# Altium project switch-box.PrjPcb (part 2 of 2)

## Sheet Sensor_Section.SchDoc
size A4; DocumentNumber: 4; SheetNumber: 4; SheetTotal: 8
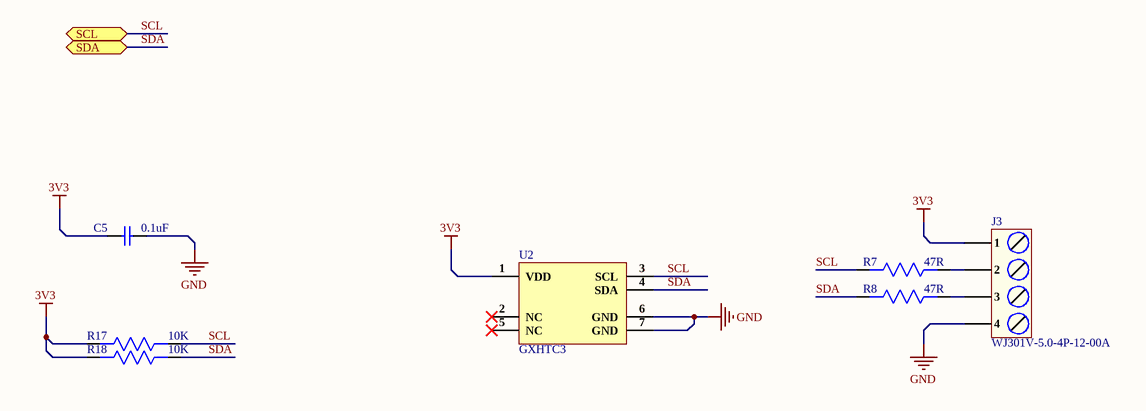
[diagram p3: Sensor_Section.SchDoc]

### Parts
C5  0.1uF  [Cap-0402]
J3  WJ301V-5.0-4P-12-00A  [WJ301V-5.0-4P-12-00A]
R7  47R  [Res-0402]
R8  47R  [Res-0402]
R17  10K  [Res-0603]
R18  10K  [Res-0603]
U2  GXHTC3  [DFN-6-EP(2x2)]

### Ports
SCL (bidir), SDA (bidir)

### Nets
3V3: C5.1 J3.1 R17.2 R18.2 U2.1(VDD)
GND: C5.2 J3.4 U2.6(GND) U2.7(GND)
SCL: R7.2 R17.1 U2.3(SCL) ; port SCL
SDA: R8.2 R18.1 U2.4(SDA) ; port SDA
NetJ3_2: J3.2 R7.1
NetJ3_3: J3.3 R8.1

Not connected (* = marked no-connect by the designer): U2 2(NC)* 5(NC)*

### Library data of the parts
C5 = C1005X5R1H104K050BB: CAP CER 0.1UF 50V X5R 0402; Manufacturer: TDK; Dielectric Material: Ceramic; Capacitance: 100nF; Tolerance: 10%; Supplier 1: Digi-Key; Manufacturer Part Number: C1005X5R1H104K050BB; Stock 1: 1455182; Pricing 1: 1=0.12, 10=0.09, 50=0.049, 100=0.04, 500=0.02858, 1000=0.02245, 2500=0.02041, 5000=0.01878 (USD); Mount: Surface Mount; Case/Package: 0402; Case Code (Metric): 1005; Case Code (Imperial): 0402; Weight: 2.3E-05oz; Min Operating Temperature: -55°C; Max Operating Temperature: 85°C; Dielectric: X5R; Voltage Rating: 50V; Packaging: Tape and Reel; Voltage Rating (DC): 50V; Termination: SMD/SMT; Construction: Flat; Package Quantity: 1; Resistor Type: Ceramic; Voltage: 50V; Series: C; Length: 1mm; Width: 0.02inch; Height: 0.5mm; Depth: 0.5mm; Thickness: 0.022inch; Radiation Hardening: No; Lead Free: Lead Free; REACH SVHC: No SVHC; RoHS Compliant: Yes; ComponentLink1URL: https://product.tdk.com/info/en/catalog/spec/mlccspec_commercial_general_midvoltage_en.pdf?src-supplier=Digi-Key; ComponentLink1Description: https://product.tdk.com/info/en/catalog/spec/mlccspec_commercial_general_midvoltage_en.pdf?src-supplier=Digi-Key; ComponentLink2URL: http://www.tdk.co.jp/tefe02/e413_c.pdf?src-supplier=Future+Electronics; ComponentLink2Description: http://www.tdk.co.jp/tefe02/e413_c.pdf?src-supplier=Future+Electronics; ComponentLink3URL: https://www.verical.com/server-webapp/html/getDatasheet?partID=743571&src-supplier=Verical; ComponentLink3Description: https://www.verical.com/server-webapp/html/getDatasheet?partID=743571&src-supplier=Verical; ComponentLink4URL: http://www.tdk.co.jp/tefe02/e412_c.pdf?src-supplier=Avnet+Europe; ComponentLink4Description: http://www.tdk.co.jp/tefe02/e412_c.pdf?src-supplier=Avnet+Europe; Supplier Part Number 1: 445-5942-1-ND; LCSC Part Number: C2181865
J3 = WJ301V-5.0-4P-12-00A: Plugin,P=5mm Screw terminal ROHS; Manufacturer: Ningbo Kangnex Elec; Item Type: Terminal Block; Manufacturer Part Number: WJ301V-5.0-4P-12-00A; Package: Plugin,P=5mm; LCSC Part Number: C3031442; ComponentLink1Description: LCSC; ComponentLink1URL: https://www.lcsc.com/product-detail/Screw-terminal_Ningbo-Kangnex-Elec-WJ301V-5-0-4P-12-00A_C3031442.html
R7 R8 = ERJ-2RKF47R0X: RES SMD 47 OHM 1% 1/10W 0402; Manufacturer: Panasonic; Temperature Coefficient: 100ppm/°C; Power Rating: 100mW; Voltage Rating: 50V; Item Type: Resistor; Supplier 1: Avnet; Manufacturer Part Number: ERJ-2RKF47R0X; RoHS: Yes; Category: Chip SMD Resistors; Stock 1: 48669; Pricing 1: 1=0.08100, 25=0.03700, 100=0.01500, 250=0.01300, 500=0.01000, 1000=0.00700, 2500=0.00500 (USD); Mount: Surface Mount; Case/Package: 0402; Number of Pins: 2; Contact Plating: Tin; Case Code (Metric): 1005; Case Code (Imperial): 0402; Weight: 2.8E-05oz; Min Operating Temperature: -55°C; Max Operating Temperature: 155°C; Resistance: 47R; Tolerance: 1%; Resistor Type: Thick Film; Packaging: Tape and Reel; Package Quantity: 1; Number of Terminations: 2; Termination: SMD/SMT; Max Power Dissipation: 100mW; Voltage Rating (DC): 50V; Features: Automotive AEC-Q200; Series: ERJ; Resistance Tolerance: 1%; Construction: Rectangular; Technology: THICK FILM; Length: 1mm; Width: 0.5mm; Height: 0.35mm; Depth: 0.5mm; Reach SVHC Compliant: Yes; Military Standard: Not; Lead Free: Lead Free; RoHS Compliant: Yes; ComponentLink1URL: https://datasheet.ciiva.com/11821/0900766b80f80784-11821333.pdf?src-supplier=RSComponents; ComponentLink1Description: https://datasheet.ciiva.com/11821/0900766b80f80784-11821333.pdf?src-supplier=RSComponents; ComponentLink2URL: https://datasheet.ciiva.com/6082/aoa0000ce2-6082054.pdf?src-supplier=Farnell; ComponentLink2Description: https://datasheet.ciiva.com/6082/aoa0000ce2-6082054.pdf?src-supplier=Farnell; ComponentLink3URL: https://datasheet.ciiva.com/7886/aoa0000ce2-7886719.pdf?src-supplier=Element14; ComponentLink3Description: https://datasheet.ciiva.com/7886/aoa0000ce2-7886719.pdf?src-supplier=Element14; ComponentLink4URL: https://datasheet.ciiva.com/7887/426256-7887019.pdf?src-supplier=Element14; ComponentLink4Description: https://datasheet.ciiva.com/7887/426256-7887019.pdf?src-supplier=Element14; ComponentLink5URL: https://datasheet.ciiva.com/43467/1678782-43467189.pdf?src-supplier=Farnell; ComponentLink5Description: https://datasheet.ciiva.com/43467/1678782-43467189.pdf?src-supplier=Farnell; ComponentLink6URL: https://datasheet.ciiva.com/46373/1678782-46373909.pdf?src-supplier=Element14; ComponentLink6Description: https://datasheet.ciiva.com/46373/1678782-46373909.pdf?src-supplier=Element14; ComponentLink7URL: https://datasheet.ciiva.com/22684/1678782-22684775.pdf?src-supplier=Element14; ComponentLink7Description: https://datasheet.ciiva.com/22684/1678782-22684775.pdf?src-supplier=Element14; ComponentLink8URL: https://datasheet.ciiva.com/46373/1678782-46373910.pdf?src-supplier=Element14; ComponentLink8Description: https://datasheet.ciiva.com/46373/1678782-46373910.pdf?src-supplier=Element14; ComponentLink9URL: https://datasheet.ciiva.com/24165/aoa0000ce2-24165246.pdf?src-supplier=Mouser; ComponentLink9Description: https://datasheet.ciiva.com/24165/aoa0000ce2-24165246.pdf?src-supplier=Mouser; ComponentLink10URL: https://datasheet.ciiva.com/16786/70260748-16786359.pdf?src-supplier=Allied+Electronics; ComponentLink10Description: https://datasheet.ciiva.com/16786/70260748-16786359.pdf?src-supplier=Allied+Electronics; ComponentLink11URL: https://datasheet.ciiva.com/16783/70260748-16783259.pdf?src-supplier=Allied+Electronics; ComponentLink11Description: https://datasheet.ciiva.com/16783/70260748-16783259.pdf?src-supplier=Allied+Electronics; ComponentLink12URL: https://datasheet.ciiva.com/9189/aoa0000ce2-9189325.pdf?src-supplier=Avnet; ComponentLink12Description: https://datasheet.ciiva.com/9189/aoa0000ce2-9189325.pdf?src-supplier=Avnet; ComponentLink13URL: https://datasheet.ciiva.com/9189/aoa0000ce2-9189323.pdf?src-supplier=Avnet; ComponentLink13Description: https://datasheet.ciiva.com/9189/aoa0000ce2-9189323.pdf?src-supplier=Avnet; Supplier Part Number 1: 64R5286; LCSC Part Number: C413056
R17 R18 = RC0603FR-0710KL: RES SMD 10K Ohm 1% 1/10W 0603; Manufacturer: Yageo; Resistance: 10kR; Temperature Coefficient: 100ppm/°C; Voltage Rating (DC): 50V; Power Rating: 100mW; Voltage Rating: 75V; Supplier 1: Digi-Key; Manufacturer Part Number: RC0603FR-0710KL; RoHS: Yes; Category: Chip SMD Resistors; Stock 1: 25249139; Pricing 1: 1=0.10000, 10=0.02400, 100=0.00970, 1000=0.00436, 2500=0.00378 (USD); Case/Package: 0603; Number of Pins: 2; Case Code (Imperial): 0603; Case Code (Metric): 1608; Weight: 7.1E-05oz; Size Code: 0603; Min Operating Temperature: -55°C; Max Operating Temperature: 155°C; Tolerance: 1%; Resistor Type: Thick Film; Packaging: Tape and Reel; Termination: SMD/SMT; Features: Moisture Resistant; Series: RC; Max Power Dissipation: 100mW; Number of Terminations: 2; Resistance Tolerance: 1%; Construction: Rectangular; Length: 1.6mm; Width: 0.8mm; Height: 0.45mm; Depth: 0.8mm; Lead Pitch: 0.3mm; REACH SVHC: Unknown; Lead Free: Lead Free; Military Standard: Not; RoHS Compliant: Yes; ComponentLink1URL: https://datasheet.ciiva.com/7660/38590-7660789.pdf?src-supplier=Element14; ComponentLink1Description: https://datasheet.ciiva.com/7660/38590-7660789.pdf?src-supplier=Element14; ComponentLink2URL: https://datasheet.ciiva.com/7983/443971-7983596.pdf?src-supplier=Element14; ComponentLink2Description: https://datasheet.ciiva.com/7983/443971-7983596.pdf?src-supplier=Element14; ComponentLink3URL: https://datasheet.ciiva.com/22747/443971-22747519.pdf?src-supplier=Element14; ComponentLink3Description: https://datasheet.ciiva.com/22747/443971-22747519.pdf?src-supplier=Element14; ComponentLink4URL: https://datasheet.ciiva.com/46440/1868787-46440891.pdf?src-supplier=Element14; ComponentLink4Description: https://datasheet.ciiva.com/46440/1868787-46440891.pdf?src-supplier=Element14; ComponentLink5URL: https://datasheet.ciiva.com/7746/1738695-7746239.pdf?src-supplier=Element14; ComponentLink5Description: https://datasheet.ciiva.com/7746/1738695-7746239.pdf?src-supplier=Element14; ComponentLink6URL: https://datasheet.ciiva.com/15189/getdatasheetpartid-409289-15189591.pdf?src-supplier=Verical; ComponentLink6Description: https://datasheet.ciiva.com/15189/getdatasheetpartid-409289-15189591.pdf?src-supplier=Verical; Supplier Part Number 1: 311-10.0KHRCT-ND; LCSC Part Number: C98220
U2 = GXHTC3: DFN-6-EP(2x2) Temperature and Humidity Sensor ROHS; Manufacturer: GXCAS; Item Type: Temperature & Humidity Sensor; Manufacturer Part Number: GXHTC3; Package: DFN-6-EP(2x2); LCSC Part Number: C2837688; ComponentLink1Description: LCSC; ComponentLink1URL: https://www.lcsc.com/product-detail/Temperature-and-Humidity-Sensor_GXCAS-GXHTC3_C2837688.html

## Sheet Isolator_Section.SchDoc
size A; DocumentNumber: 5; SheetNumber: 5; SheetTotal: 8
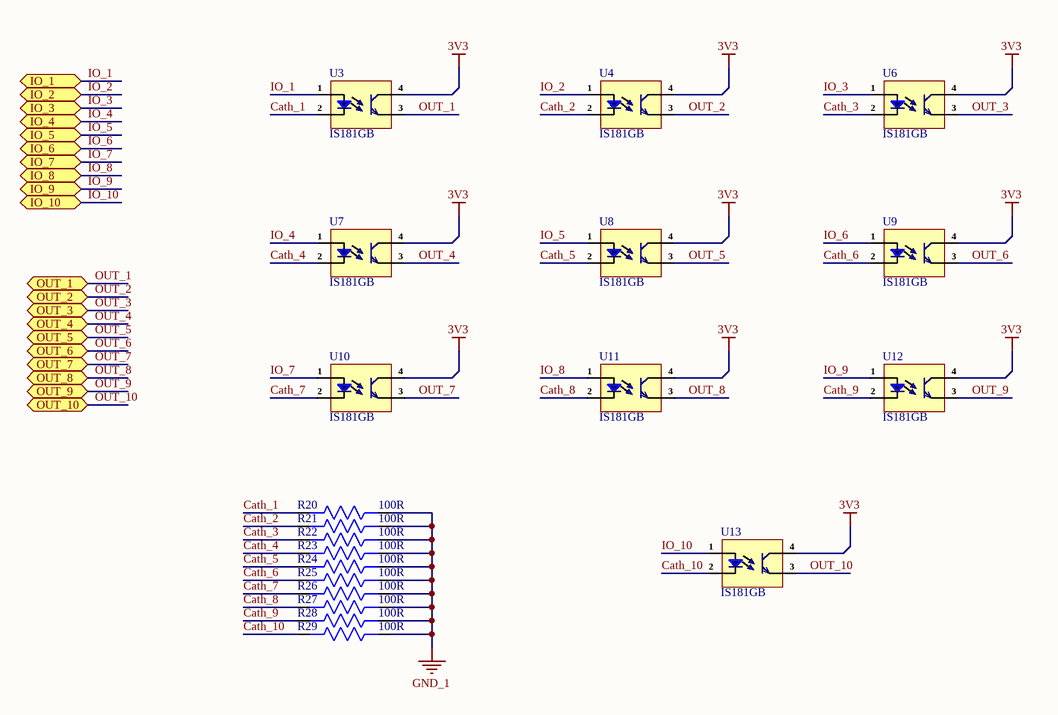
[diagram p4: Isolator_Section.SchDoc]

### Parts
R20  100R  [Res-0402]
R21  100R  [Res-0402]
R22  100R  [Res-0402]
R23  100R  [Res-0402]
R24  100R  [Res-0402]
R25  100R  [Res-0402]
R26  100R  [Res-0402]
R27  100R  [Res-0402]
R28  100R  [Res-0402]
R29  100R  [Res-0402]
U3  IS181GB  [SOP-4_2.54]
U4  IS181GB  [SOP-4_2.54]
U6  IS181GB  [SOP-4_2.54]
U7  IS181GB  [SOP-4_2.54]
U8  IS181GB  [SOP-4_2.54]
U9  IS181GB  [SOP-4_2.54]
U10  IS181GB  [SOP-4_2.54]
U11  IS181GB  [SOP-4_2.54]
U12  IS181GB  [SOP-4_2.54]
U13  IS181GB  [SOP-4_2.54]

### Ports
IO_1 (bidir), IO_2 (bidir), IO_3 (bidir), IO_4 (bidir), IO_5 (bidir), IO_6 (bidir), IO_7 (bidir), IO_8 (bidir), IO_9 (bidir), IO_10 (bidir), OUT_1 (bidir), OUT_2 (bidir), OUT_3 (bidir), OUT_4 (bidir), OUT_5 (bidir), OUT_6 (bidir), OUT_7 (bidir), OUT_8 (bidir), OUT_9 (bidir), OUT_10 (bidir)

### Nets
3V3: U3.4(C) U4.4(C) U6.4(C) U7.4(C) U8.4(C) U9.4(C) U10.4(C) U11.4(C) U12.4(C) U13.4(C)
GND_1: R20.1 R21.1 R22.1 R23.1 R24.1 R25.1 R26.1 R27.1 R28.1 R29.1
Cath_1: R20.2 U3.2(Ca)
Cath_2: R21.2 U4.2(Ca)
Cath_3: R22.2 U6.2(Ca)
Cath_4: R23.2 U7.2(Ca)
Cath_5: R24.2 U8.2(Ca)
Cath_6: R25.2 U9.2(Ca)
Cath_7: R26.2 U10.2(Ca)
Cath_8: R27.2 U11.2(Ca)
Cath_9: R28.2 U12.2(Ca)
Cath_10: R29.2 U13.2(Ca)
IO_1: U3.1(An) ; port IO_1
IO_2: U4.1(An) ; port IO_2
IO_3: U6.1(An) ; port IO_3
IO_4: U7.1(An) ; port IO_4
IO_5: U8.1(An) ; port IO_5
IO_6: U9.1(An) ; port IO_6
IO_7: U10.1(An) ; port IO_7
IO_8: U11.1(An) ; port IO_8
IO_9: U12.1(An) ; port IO_9
IO_10: U13.1(An) ; port IO_10
OUT_1: U3.3(E) ; port OUT_1
OUT_2: U4.3(E) ; port OUT_2
OUT_3: U6.3(E) ; port OUT_3
OUT_4: U7.3(E) ; port OUT_4
OUT_5: U8.3(E) ; port OUT_5
OUT_6: U9.3(E) ; port OUT_6
OUT_7: U10.3(E) ; port OUT_7
OUT_8: U11.3(E) ; port OUT_8
OUT_9: U12.3(E) ; port OUT_9
OUT_10: U13.3(E) ; port OUT_10

### Library data of the parts
R20-R29 = RC0402FR-07100RL: RES 100 OHM 1% 1/16W 0402; Manufacturer: Yageo; Power Rating: 62.5mW; Voltage Rating: 50V; Temperature Coefficient: 100ppm/°C; Max Power Dissipation: 63mW; Supplier 1: Mouser; Manufacturer Part Number: RC0402FR-07100RL; RoHS: Yes; Category: Chip SMD Resistors; Stock 1: 699545; Pricing 1: 1=0.10000, 10=0.01200, 50=0.01200, 100=0.00500, 1000=0.00300, 2500=0.00200, 10000=0.00100 (USD); Case/Package: 0402; Number of Pins: 2; Case Code (Imperial): 0402; Case Code (Metric): 1005; Size Code: 0402; Min Operating Temperature: -55°C; Max Operating Temperature: 155°C; Tolerance: 1%; Voltage Rating (DC): 50V; Resistance: 100R; Packaging: Tape and Reel; Termination: SMD/SMT; Resistor Type: Thick Film; Features: Moisture Resistant; Series: RC; Number of Terminations: 2; Resistance Tolerance: 1%; Construction: Rectangular; Technology: THICK FILM; Length: 1mm; Width: 0.5mm; Height: 0.32mm; Depth: 0.5mm; RoHS Compliant: Yes; REACH SVHC: No SVHC; Military Standard: Not; Lead Free: Lead Free; ComponentLink1URL: https://datasheet.ciiva.com/11808/0900766b80c66297-11808765.pdf?src-supplier=RSComponents; ComponentLink1Description: https://datasheet.ciiva.com/11808/0900766b80c66297-11808765.pdf?src-supplier=RSComponents; ComponentLink2URL: https://datasheet.ciiva.com/7849/1784430-7849810.pdf?src-supplier=Element14; ComponentLink2Description: https://datasheet.ciiva.com/7849/1784430-7849810.pdf?src-supplier=Element14; ComponentLink3URL: https://datasheet.ciiva.com/28367/1018594-28367226.pdf?src-supplier=Element14; ComponentLink3Description: https://datasheet.ciiva.com/28367/1018594-28367226.pdf?src-supplier=Element14; ComponentLink4URL: https://datasheet.ciiva.com/22747/1018594-22747511.pdf?src-supplier=Element14; ComponentLink4Description: https://datasheet.ciiva.com/22747/1018594-22747511.pdf?src-supplier=Element14; ComponentLink5URL: https://datasheet.ciiva.com/12667/pyu-rc0402-51-rohs-l-6-r-12667957.pdf?src-supplier=Mouser; ComponentLink5Description: https://datasheet.ciiva.com/12667/pyu-rc0402-51-rohs-l-6-r-12667957.pdf?src-supplier=Mouser; ComponentLink6URL: https://datasheet.ciiva.com/15189/getdatasheetpartid-329466-15189335.pdf?src-supplier=Verical; ComponentLink6Description: https://datasheet.ciiva.com/15189/getdatasheetpartid-329466-15189335.pdf?src-supplier=Verical; ComponentLink7URL: https://datasheet.ciiva.com/16740/pyu-rc0402-51-rohs-l-6-r-16740566.pdf?src-supplier=Future+Electronics; ComponentLink7Description: https://datasheet.ciiva.com/16740/pyu-rc0402-51-rohs-l-6-r-16740566.pdf?src-supplier=Future+Electronics; Supplier Part Number 1: 603-RC0402FR-07100RL; LCSC Part Number: C106232
U3 U4 U6-U13 = IS181GB: Optoisolator Transistor Output 3750Vrms 1 Channel; Manufacturer: Isocom; Forward Current: 50mA; Reverse Breakdown Voltage: 6V; Isolation Voltage: 3.75kV; Rise Time: 18000ns; Power Dissipation: 170mW; Number of Elements: 1; Collector Emitter Saturation Voltage: 200mV; Forward Voltage: 1.4V; Collector Emitter Voltage (VCEO): 80V; Current Transfer Ratio: 600%; Item Type: Optocoupler; Supplier 1: Arrow Electronics; Manufacturer Part Number: IS181GB; RoHS: Yes; Category: Optocouplers; Stock 1: 2922; Pricing 1: 1=0.55080, 10=0.34190, 25=0.33860, 50=0.33530, 100=0.19360, 250=0.19160, 500=0.18960, 1000=0.14750 (USD); Mount: Surface Mount; Case/Package: SMD/SMT; Number of Pins: 4; Min Operating Temperature: -55°C; Max Operating Temperature: 100°C; Fall Time: 18000ns; Radiation Hardening: No; Lead Free: Lead Free; RoHS Compliant: Yes; ComponentLink1URL: https://datasheet.ciiva.com/26895/getdatasheetpartid-624485-26895717.pdf?src-supplier=Verical; ComponentLink1Description: https://datasheet.ciiva.com/26895/getdatasheetpartid-624485-26895717.pdf?src-supplier=Verical; ComponentLink2URL: https://datasheet.ciiva.com/29301/183289-da-01-en-optokoppler-is181-gb-29301106.pdf?src-supplier=Conrad; ComponentLink2Description: https://datasheet.ciiva.com/29301/183289-da-01-en-optokoppler-is181-gb-29301106.pdf?src-supplier=Conrad; Supplier Part Number 1: IS181GB; LCSC Part Number: C84196

## Sheet Relay_Section.SchDoc: =Projectname
size A4; DocumentNumber: 7; SheetNumber: 7; SheetTotal: 8
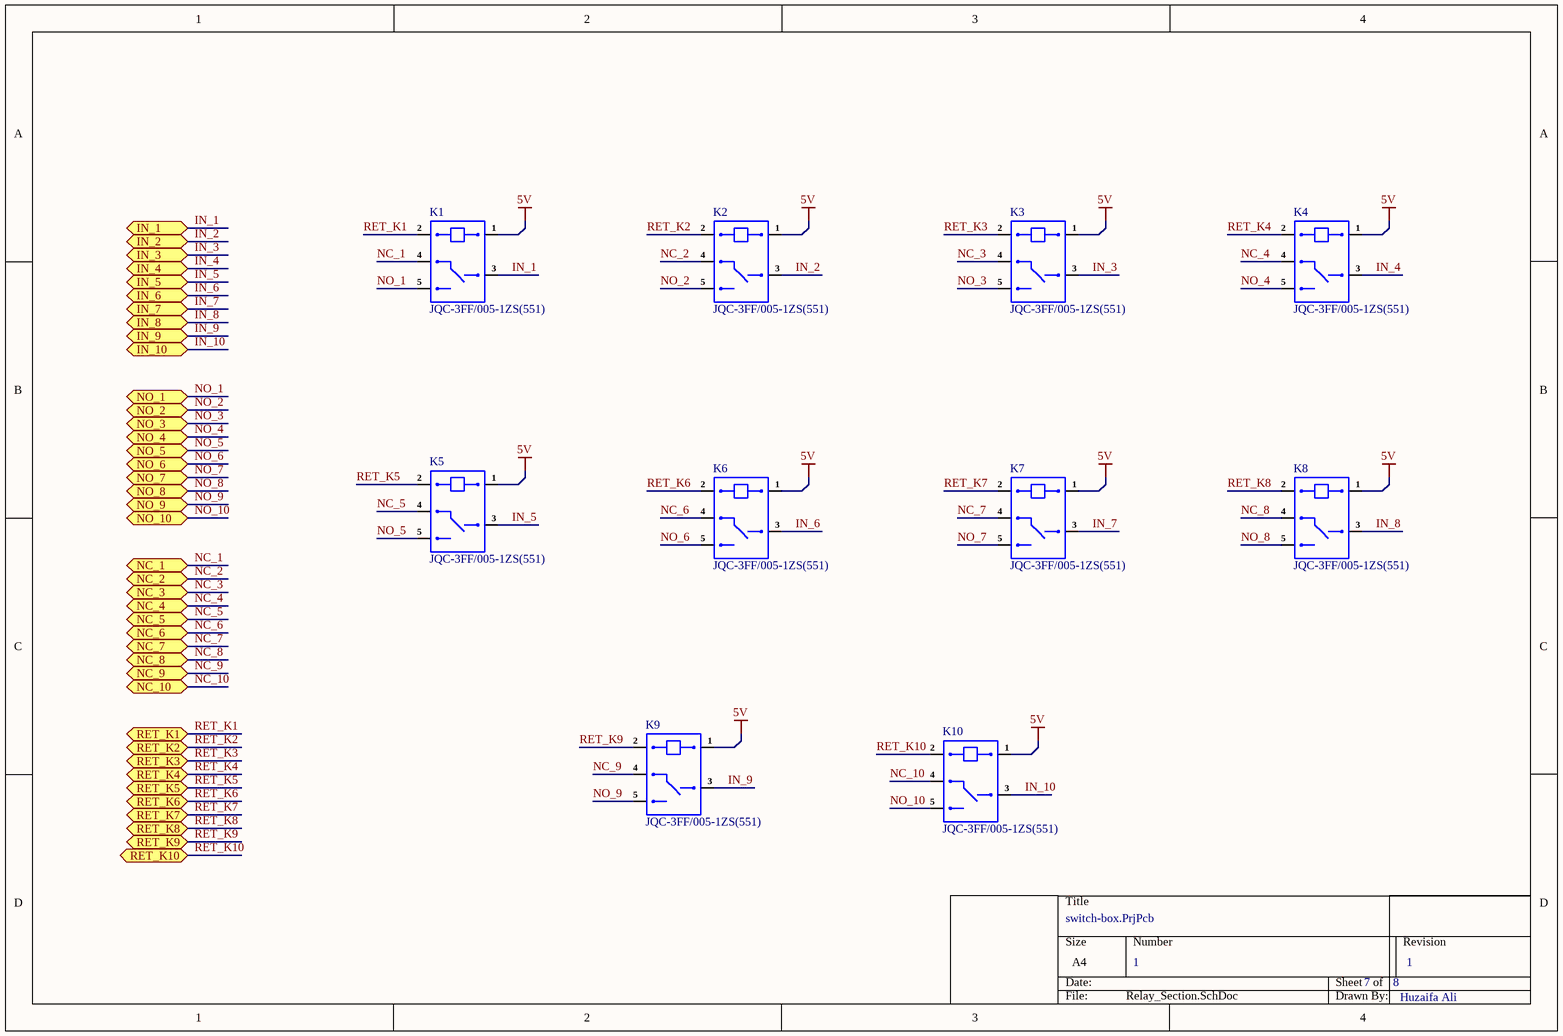
[diagram p5: Relay_Section.SchDoc]

### Parts
K1  JQC-3FF/005-1ZS(551)  [JQC-3FF/005-1ZS(551)]
K2  JQC-3FF/005-1ZS(551)  [JQC-3FF/005-1ZS(551)]
K3  JQC-3FF/005-1ZS(551)  [JQC-3FF/005-1ZS(551)]
K4  JQC-3FF/005-1ZS(551)  [JQC-3FF/005-1ZS(551)]
K5  JQC-3FF/005-1ZS(551)  [JQC-3FF/005-1ZS(551)]
K6  JQC-3FF/005-1ZS(551)  [JQC-3FF/005-1ZS(551)]
K7  JQC-3FF/005-1ZS(551)  [JQC-3FF/005-1ZS(551)]
K8  JQC-3FF/005-1ZS(551)  [JQC-3FF/005-1ZS(551)]
K9  JQC-3FF/005-1ZS(551)  [JQC-3FF/005-1ZS(551)]
K10  JQC-3FF/005-1ZS(551)  [JQC-3FF/005-1ZS(551)]

### Ports
IN_1 (bidir), IN_2 (bidir), IN_3 (bidir), IN_4 (bidir), IN_5 (bidir), IN_6 (bidir), IN_7 (bidir), IN_8 (bidir), IN_9 (bidir), IN_10 (bidir), NC_1 (bidir), NC_2 (bidir), NC_3 (bidir), NC_4 (bidir), NC_5 (bidir), NC_6 (bidir), NC_7 (bidir), NC_8 (bidir), NC_9 (bidir), NC_10 (bidir), NO_1 (bidir), NO_2 (bidir), NO_3 (bidir), NO_4 (bidir), NO_5 (bidir), NO_6 (bidir), NO_7 (bidir), NO_8 (bidir), NO_9 (bidir), NO_10 (bidir), RET_K1 (bidir), RET_K2 (bidir), RET_K3 (bidir), RET_K4 (bidir), RET_K5 (bidir), RET_K6 (bidir), RET_K7 (bidir), RET_K8 (bidir), RET_K9 (bidir), RET_K10 (bidir)

### Nets
5V: K1.1 K2.1 K3.1 K4.1 K5.1 K6.1 K7.1 K8.1 K9.1 K10.1
IN_1: K1.3 ; port IN_1
IN_2: K2.3 ; port IN_2
IN_3: K3.3 ; port IN_3
IN_4: K4.3 ; port IN_4
IN_5: K5.3 ; port IN_5
IN_6: K6.3 ; port IN_6
IN_7: K7.3 ; port IN_7
IN_8: K8.3 ; port IN_8
IN_9: K9.3 ; port IN_9
IN_10: K10.3 ; port IN_10
NC_1: K1.4 ; port NC_1
NC_2: K2.4 ; port NC_2
NC_3: K3.4 ; port NC_3
NC_4: K4.4 ; port NC_4
NC_5: K5.4 ; port NC_5
NC_6: K6.4 ; port NC_6
NC_7: K7.4 ; port NC_7
NC_8: K8.4 ; port NC_8
NC_9: K9.4 ; port NC_9
NC_10: K10.4 ; port NC_10
NO_1: K1.5 ; port NO_1
NO_2: K2.5 ; port NO_2
NO_3: K3.5 ; port NO_3
NO_4: K4.5 ; port NO_4
NO_5: K5.5 ; port NO_5
NO_6: K6.5 ; port NO_6
NO_7: K7.5 ; port NO_7
NO_8: K8.5 ; port NO_8
NO_9: K9.5 ; port NO_9
NO_10: K10.5 ; port NO_10
RET_K1: K1.2 ; port RET_K1
RET_K2: K2.2 ; port RET_K2
RET_K3: K3.2 ; port RET_K3
RET_K4: K4.2 ; port RET_K4
RET_K5: K5.2 ; port RET_K5
RET_K6: K6.2 ; port RET_K6
RET_K7: K7.2 ; port RET_K7
RET_K8: K8.2 ; port RET_K8
RET_K9: K9.2 ; port RET_K9
RET_K10: K10.2 ; port RET_K10

### Notes on the sheet
- 1
- Huzaifa Ali

### Library data of the parts
K1-K10 = JQC-3FF/005-1ZS(551): AgCdO 5V 10A SPDT (1 Form C) Electromagnetic Relay-Single Coil Plugin Power Relays ROHS; Manufacturer: HF(Xiamen Hongfa Electroacoustic); Item Type: Relay; Manufacturer Part Number: JQC-3FF/005-1ZS(551); Package: Plugin; LCSC Part Number: C9221; ComponentLink1Description: LCSC; ComponentLink1URL: https://www.lcsc.com/product-detail/Power-Relays_HF-Xiamen-Hongfa-Electroacoustic-JQC-3FF-005-1ZS-551_C9221.html

## Sheet Connector_Section.SchDoc
size A; DocumentNumber: 8; SheetNumber: 8; SheetTotal: 8
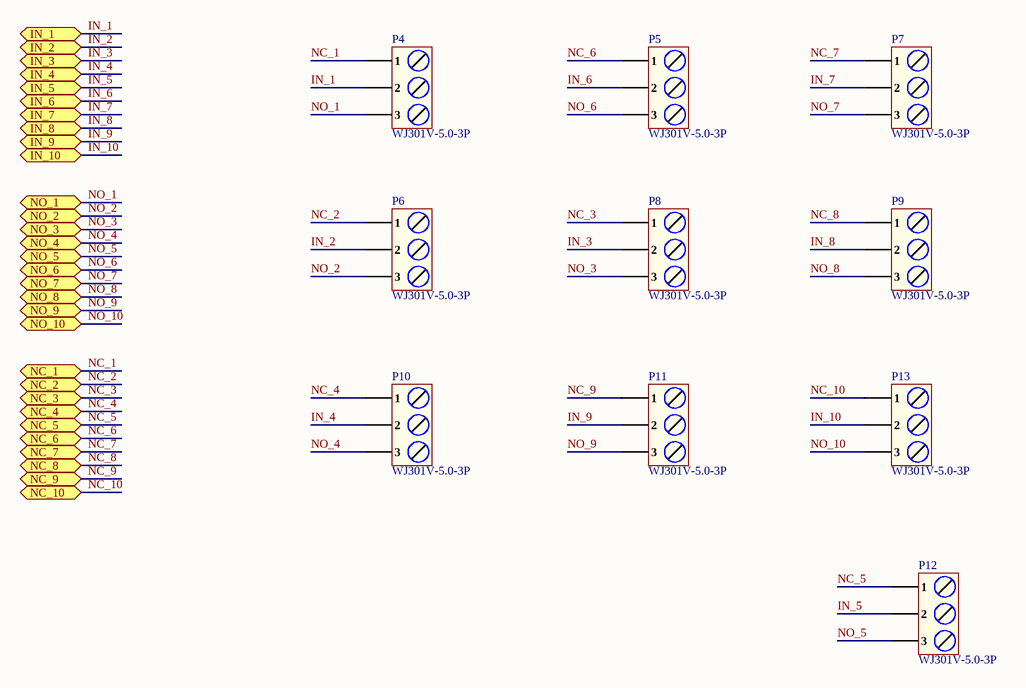
[diagram p6: Connector_Section.SchDoc]

### Parts
P4  WJ301V-5.0-3P  [WJ301V-5.0-3P]
P5  WJ301V-5.0-3P  [WJ301V-5.0-3P]
P6  WJ301V-5.0-3P  [WJ301V-5.0-3P]
P7  WJ301V-5.0-3P  [WJ301V-5.0-3P]
P8  WJ301V-5.0-3P  [WJ301V-5.0-3P]
P9  WJ301V-5.0-3P  [WJ301V-5.0-3P]
P10  WJ301V-5.0-3P  [WJ301V-5.0-3P]
P11  WJ301V-5.0-3P  [WJ301V-5.0-3P]
P12  WJ301V-5.0-3P  [WJ301V-5.0-3P]
P13  WJ301V-5.0-3P  [WJ301V-5.0-3P]

### Ports
IN_1 (bidir), IN_2 (bidir), IN_3 (bidir), IN_4 (bidir), IN_5 (bidir), IN_6 (bidir), IN_7 (bidir), IN_8 (bidir), IN_9 (bidir), IN_10 (bidir), NC_1 (bidir), NC_2 (bidir), NC_3 (bidir), NC_4 (bidir), NC_5 (bidir), NC_6 (bidir), NC_7 (bidir), NC_8 (bidir), NC_9 (bidir), NC_10 (bidir), NO_1 (bidir), NO_2 (bidir), NO_3 (bidir), NO_4 (bidir), NO_5 (bidir), NO_6 (bidir), NO_7 (bidir), NO_8 (bidir), NO_9 (bidir), NO_10 (bidir)

### Nets
IN_1: P4.2 ; port IN_1
IN_2: P6.2 ; port IN_2
IN_3: P8.2 ; port IN_3
IN_4: P10.2 ; port IN_4
IN_5: P12.2 ; port IN_5
IN_6: P5.2 ; port IN_6
IN_7: P7.2 ; port IN_7
IN_8: P9.2 ; port IN_8
IN_9: P11.2 ; port IN_9
IN_10: P13.2 ; port IN_10
NC_1: P4.1 ; port NC_1
NC_2: P6.1 ; port NC_2
NC_3: P8.1 ; port NC_3
NC_4: P10.1 ; port NC_4
NC_5: P12.1 ; port NC_5
NC_6: P5.1 ; port NC_6
NC_7: P7.1 ; port NC_7
NC_8: P9.1 ; port NC_8
NC_9: P11.1 ; port NC_9
NC_10: P13.1 ; port NC_10
NO_1: P4.3 ; port NO_1
NO_2: P6.3 ; port NO_2
NO_3: P8.3 ; port NO_3
NO_4: P10.3 ; port NO_4
NO_5: P12.3 ; port NO_5
NO_6: P5.3 ; port NO_6
NO_7: P7.3 ; port NO_7
NO_8: P9.3 ; port NO_8
NO_9: P11.3 ; port NO_9
NO_10: P13.3 ; port NO_10

### Library data of the parts
P4-P13 = WJ301V-5.0-3P: P=5.0mm Screw terminal RoHS; Manufacturer: Ningbo Kangnex Elec; Item Type: Terminal Block; Manufacturer Part Number: WJ301V-5.0-3P; Package: Custom; LCSC Part Number: C8483; ComponentLink1Description: LCSC; ComponentLink1URL: https://www.lcsc.com/product-detail/Screw-terminal_Ningbo-Kangnex-Elec-WJ301V-5-0-3P_C8483.html

## Sheet Driver_Section.SchDoc
size A4; DocumentNumber: 6; SheetNumber: 6; SheetTotal: 8
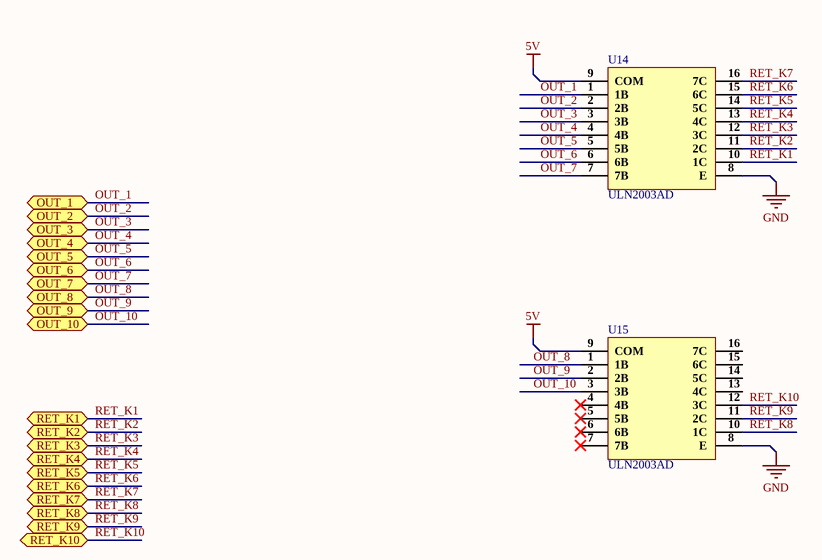
[diagram p7: Driver_Section.SchDoc]

### Parts
U14  ULN2003AD  [16-SOIC]
U15  ULN2003AD  [16-SOIC]

### Ports
OUT_1 (bidir), OUT_2 (bidir), OUT_3 (bidir), OUT_4 (bidir), OUT_5 (bidir), OUT_6 (bidir), OUT_7 (bidir), OUT_8 (bidir), OUT_9 (bidir), OUT_10 (bidir), RET_K1 (bidir), RET_K2 (bidir), RET_K3 (bidir), RET_K4 (bidir), RET_K5 (bidir), RET_K6 (bidir), RET_K7 (bidir), RET_K8 (bidir), RET_K9 (bidir), RET_K10 (bidir)

### Nets
5V: U14.9(COM) U15.9(COM)
GND: U14.8(E) U15.8(E)
OUT_1: U14.1(1B) ; port OUT_1
OUT_2: U14.2(2B) ; port OUT_2
OUT_3: U14.3(3B) ; port OUT_3
OUT_4: U14.4(4B) ; port OUT_4
OUT_5: U14.5(5B) ; port OUT_5
OUT_6: U14.6(6B) ; port OUT_6
OUT_7: U14.7(7B) ; port OUT_7
OUT_8: U15.1(1B) ; port OUT_8
OUT_9: U15.2(2B) ; port OUT_9
OUT_10: U15.3(3B) ; port OUT_10
RET_K1: U14.10(1C) ; port RET_K1
RET_K2: U14.11(2C) ; port RET_K2
RET_K3: U14.12(3C) ; port RET_K3
RET_K4: U14.13(4C) ; port RET_K4
RET_K5: U14.14(5C) ; port RET_K5
RET_K6: U14.15(6C) ; port RET_K6
RET_K7: U14.16(7C) ; port RET_K7
RET_K8: U15.10(1C) ; port RET_K8
RET_K9: U15.11(2C) ; port RET_K9
RET_K10: U15.12(3C) ; port RET_K10

Not connected (* = marked no-connect by the designer): U15 4(4B)* 5(5B)* 6(6B)* 7(7B)* 13(4C) 14(5C) 15(6C) 16(7C)

### Library data of the parts
U14 U15 = ULN2003AD: TRANS 7NPN DARL 50V 0.5A 16SOIC; Manufacturer: Texas Instruments; Max Collector Current: 500mA; Number of Elements: 7; Polarity: NPN; Collector Emitter Saturation Voltage: 1.1V; Collector-emitter Voltage-Max: 1.6V; Max Power Dissipation: 25W; Item Type: IC; Supplier 1: Arrow Electronics; Manufacturer Part Number: ULN2003AD; RoHS: Yes; Category: Integrated Circuits (ICs); Stock 1: 228; Pricing 1: 1=1.68680, 10=1.54200, 100=1.39890, 500=1.31050, 1000=1.23410 (USD); Mount: Surface Mount; Case/Package: SOIC; Number of Pins: 16; Weight: 0.004998oz; Contact Plating: Gold; Min Operating Temperature: -20°C; Max Operating Temperature: 70°C; Packaging: Rail/Tube; Collector Emitter Voltage (VCEO): 50V; Package Quantity: 40; Series: Automotive, AEC-Q100; Number of Drivers: 7; Collector Emitter Breakdown Voltage: 50V; Voltage Rating (DC): 50V; Current Rating: 500mA; Emitter Base Voltage (VEBO): 50V; Output Current: 500mA; Length: 9.9mm; Width: 3.91mm; Height: 1.58mm; Radiation Hardening: No; Lead Free: Lead Free; RoHS Compliant: Yes; Reach SVHC Compliant: Yes; ComponentLink1URL: https://datasheet.ciiva.com/15139/getdatasheetpartid-47909-15139875.pdf?src-supplier=Verical; ComponentLink1Description: https://datasheet.ciiva.com/15139/getdatasheetpartid-47909-15139875.pdf?src-supplier=Verical; ComponentLink2URL: https://datasheet.ciiva.com/1193/1908148-1193405.pdf?src-supplier=Element14; ComponentLink2Description: https://datasheet.ciiva.com/1193/1908148-1193405.pdf?src-supplier=Element14; ComponentLink3URL: https://datasheet.ciiva.com/1702/uln2003a-1702173.pdf?src-supplier=Digi-Key; ComponentLink3Description: https://datasheet.ciiva.com/1702/uln2003a-1702173.pdf?src-supplier=Digi-Key; ComponentLink4URL: https://datasheet.ciiva.com/14424/ulq2003a-14424058.pdf?src-supplier=Avnet; ComponentLink4Description: https://datasheet.ciiva.com/14424/ulq2003a-14424058.pdf?src-supplier=Avnet; Supplier Part Number 1: ULN2003AD; LCSC Part Number: C908113

## Nets that join several sheets
3V3: USB & LDO_Section (5 pins), Controller_Section (8 pins), Sensor_Section (5 pins), Isolator_Section (10 pins)
5V: USB & LDO_Section (5 pins), Controller_Section (Q2.3 Rx1.1), Relay_Section (10 pins), Driver_Section (U14.9 U15.9)
GND: USB & LDO_Section (15 pins), Controller_Section (11 pins), Sensor_Section (C5.2 J3.4 U2.6 U2.7), Driver_Section (U14.8 U15.8)
IN_1: Relay_Section (K1.3), Connector_Section (P4.2)
IN_2: Relay_Section (K2.3), Connector_Section (P6.2)
IN_3: Relay_Section (K3.3), Connector_Section (P8.2)
IN_4: Relay_Section (K4.3), Connector_Section (P10.2)
IN_5: Relay_Section (K5.3), Connector_Section (P12.2)
IN_6: Relay_Section (K6.3), Connector_Section (P5.2)
IN_7: Relay_Section (K7.3), Connector_Section (P7.2)
IN_8: Relay_Section (K8.3), Connector_Section (P9.2)
IN_9: Relay_Section (K9.3), Connector_Section (P11.2)
IN_10: Relay_Section (K10.3), Connector_Section (P13.2)
IO_1: Controller_Section (U1.39), Isolator_Section (U3.1)
IO_2: Controller_Section (U1.38), Isolator_Section (U4.1)
IO_3: Controller_Section (U1.15), Isolator_Section (U6.1)
IO_4: Controller_Section (U1.4), Isolator_Section (U7.1)
IO_5: Controller_Section (U1.5), Isolator_Section (U8.1)
IO_6: Controller_Section (U1.6), Isolator_Section (U9.1)
IO_7: Controller_Section (U1.7), Isolator_Section (U10.1)
IO_8: Controller_Section (U1.12), Isolator_Section (U11.1)
IO_9: Controller_Section (U1.17), Isolator_Section (U12.1)
IO_10: Controller_Section (U1.18), Isolator_Section (U13.1)
NC_1: Relay_Section (K1.4), Connector_Section (P4.1)
NC_2: Relay_Section (K2.4), Connector_Section (P6.1)
NC_3: Relay_Section (K3.4), Connector_Section (P8.1)
NC_4: Relay_Section (K4.4), Connector_Section (P10.1)
NC_5: Relay_Section (K5.4), Connector_Section (P12.1)
NC_6: Relay_Section (K6.4), Connector_Section (P5.1)
NC_7: Relay_Section (K7.4), Connector_Section (P7.1)
NC_8: Relay_Section (K8.4), Connector_Section (P9.1)
NC_9: Relay_Section (K9.4), Connector_Section (P11.1)
NC_10: Relay_Section (K10.4), Connector_Section (P13.1)
NO_1: Relay_Section (K1.5), Connector_Section (P4.3)
NO_2: Relay_Section (K2.5), Connector_Section (P6.3)
NO_3: Relay_Section (K3.5), Connector_Section (P8.3)
NO_4: Relay_Section (K4.5), Connector_Section (P10.3)
NO_5: Relay_Section (K5.5), Connector_Section (P12.3)
NO_6: Relay_Section (K6.5), Connector_Section (P5.3)
NO_7: Relay_Section (K7.5), Connector_Section (P7.3)
NO_8: Relay_Section (K8.5), Connector_Section (P9.3)
NO_9: Relay_Section (K9.5), Connector_Section (P11.3)
NO_10: Relay_Section (K10.5), Connector_Section (P13.3)
OUT_1: Isolator_Section (U3.3), Driver_Section (U14.1)
OUT_2: Isolator_Section (U4.3), Driver_Section (U14.2)
OUT_3: Isolator_Section (U6.3), Driver_Section (U14.3)
OUT_4: Isolator_Section (U7.3), Driver_Section (U14.4)
OUT_5: Isolator_Section (U8.3), Driver_Section (U14.5)
OUT_6: Isolator_Section (U9.3), Driver_Section (U14.6)
OUT_7: Isolator_Section (U10.3), Driver_Section (U14.7)
OUT_8: Isolator_Section (U11.3), Driver_Section (U15.1)
OUT_9: Isolator_Section (U12.3), Driver_Section (U15.2)
OUT_10: Isolator_Section (U13.3), Driver_Section (U15.3)
RET_K1: Controller_Section (LED1.2), Relay_Section (K1.2), Driver_Section (U14.10)
RET_K2: Controller_Section (LED2.2), Relay_Section (K2.2), Driver_Section (U14.11)
RET_K3: Controller_Section (LED3.2), Relay_Section (K3.2), Driver_Section (U14.12)
RET_K4: Controller_Section (LED4.2), Relay_Section (K4.2), Driver_Section (U14.13)
RET_K5: Controller_Section (LED5.2), Relay_Section (K5.2), Driver_Section (U14.14)
RET_K6: Controller_Section (LED6.2), Relay_Section (K6.2), Driver_Section (U14.15)
RET_K7: Controller_Section (LED7.2), Relay_Section (K7.2), Driver_Section (U14.16)
RET_K8: Controller_Section (LED8.2), Relay_Section (K8.2), Driver_Section (U15.10)
RET_K9: Controller_Section (LED9.2), Relay_Section (K9.2), Driver_Section (U15.11)
RET_K10: Controller_Section (LED10.2), Relay_Section (K10.2), Driver_Section (U15.12)
SCL: Controller_Section (U1.26), Sensor_Section (R7.2 R17.1 U2.3)
SDA: Controller_Section (U1.16), Sensor_Section (R8.2 R18.1 U2.4)
USB_DM: USB & LDO_Section (C12.1 D1.4 J2.A7 J2.B7), Controller_Section (U1.13)
USB_DP: USB & LDO_Section (C11.1 D1.3 J2.A6 J2.B6), Controller_Section (U1.14)